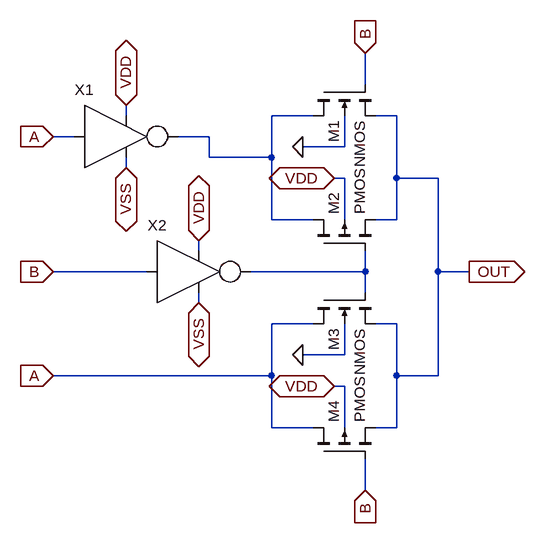
[diagram p0: schematic XOR.asc]
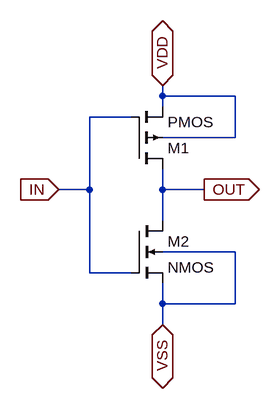
[diagram p1: sub-circuit inverter.asc]
XOR.asc, the LTspice schematic file:
Version 4.1
SHEET 1 880 680
WIRE 272 -160 272 -208
WIRE -96 -112 -96 -128
WIRE 192 -112 128 -112
WIRE 320 -112 288 -112
WIRE -176 -80 -208 -80
WIRE 32 -80 -16 -80
WIRE 240 -64 240 -112
WIRE 240 -64 176 -64
WIRE 32 -48 32 -80
WIRE 128 -48 128 -112
WIRE 128 -48 32 -48
WIRE -96 -32 -96 -48
WIRE 240 -16 224 -16
WIRE 320 -16 320 -112
WIRE 384 -16 320 -16
WIRE 128 48 128 -48
WIRE 192 48 128 48
WIRE 240 48 240 -16
WIRE 320 48 320 -16
WIRE 320 48 288 48
WIRE 16 96 16 80
WIRE -64 128 -208 128
WIRE 272 128 272 96
WIRE 272 128 96 128
WIRE 384 128 384 -16
WIRE 432 128 384 128
WIRE 272 160 272 128
WIRE 16 176 16 160
WIRE 192 208 128 208
WIRE 320 208 288 208
WIRE 240 256 240 208
WIRE 240 256 176 256
WIRE 128 288 128 208
WIRE 128 288 -208 288
WIRE 320 288 320 208
WIRE 384 288 384 128
WIRE 384 288 320 288
WIRE 240 304 224 304
WIRE 128 368 128 288
WIRE 192 368 128 368
WIRE 240 368 240 304
WIRE 320 368 320 288
WIRE 320 368 288 368
WIRE 272 464 272 416
FLAG -208 -80 A
IOPIN -208 -80 In
FLAG -208 128 B
IOPIN -208 128 In
FLAG -208 288 A
IOPIN -208 288 In
FLAG 432 128 OUT
IOPIN 432 128 Out
FLAG 272 -208 B
IOPIN 272 -208 In
FLAG 272 464 B
IOPIN 272 464 In
FLAG 224 -16 VDD
IOPIN 224 -16 BiDir
FLAG 176 -64 0
FLAG 224 304 VDD
IOPIN 224 304 BiDir
FLAG 176 256 0
FLAG -96 -128 VDD
IOPIN -96 -128 BiDir
FLAG 16 80 VDD
IOPIN 16 80 BiDir
FLAG -96 -32 VSS
IOPIN -96 -32 BiDir
FLAG 16 176 VSS
IOPIN 16 176 BiDir
SYMBOL nmos4 192 -160 M90
SYMATTR InstName M1
SYMBOL pmos4 192 96 R270
SYMATTR InstName M2
SYMBOL nmos4 192 160 M90
SYMATTR InstName M3
SYMBOL pmos4 192 416 R270
SYMATTR InstName M4
SYMBOL INVERTER -112 -80 R0
SYMATTR InstName X1
SYMBOL INVERTER 0 128 R0
SYMATTR InstName X2

inverter.asc, the sub-circuit schematic file:
Version 4.1
SHEET 1 880 680
WIRE 240 -272 240 -288
WIRE 352 -272 240 -272
WIRE 240 -256 240 -272
WIRE 192 -240 128 -240
WIRE 352 -208 352 -272
WIRE 352 -208 240 -208
WIRE 128 -128 128 -240
WIRE 128 -128 80 -128
WIRE 240 -128 240 -160
WIRE 304 -128 240 -128
WIRE 240 -80 240 -128
WIRE 352 -32 240 -32
WIRE 128 0 128 -128
WIRE 192 0 128 0
WIRE 240 48 240 16
WIRE 352 48 352 -32
WIRE 352 48 240 48
WIRE 240 80 240 48
FLAG 240 -288 VDD
IOPIN 240 -288 BiDir
FLAG 80 -128 IN
IOPIN 80 -128 In
FLAG 304 -128 OUT
IOPIN 304 -128 Out
FLAG 240 80 VSS
IOPIN 240 80 BiDir
SYMBOL pmos4 192 -160 M180
SYMATTR InstName M1
SYMBOL nmos4 192 -80 R0
SYMATTR InstName M2

The netlist it stands for:
* XOR.asc
M1 N001 B OUT 0 NMOS
M2 N001 N002 OUT VDD PMOS
M3 A N002 OUT 0 NMOS
M4 A B OUT VDD PMOS
X§X1 A N001 VDD VSS inverter
X§X2 B N002 VDD VSS inverter

* block symbol definitions
.subckt inverter IN OUT VDD VSS
M1 OUT IN VDD VDD PMOS
M2 OUT IN VSS VSS NMOS
.ends inverter

.model NMOS NMOS
.model PMOS PMOS
.lib standard.mos
.backanno
.end